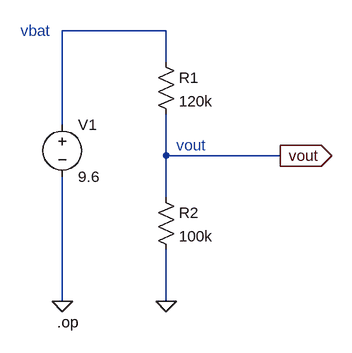
[diagram p0: schematic 01_op_dc.asc]
01_op_dc.asc, the LTspice schematic file:
Version 4.1
SHEET 1 880 680
WIRE 336 -80 176 -80
WIRE 336 -32 336 -80
WIRE 176 64 176 -80
WIRE 336 112 336 48
WIRE 512 112 336 112
WIRE 336 176 336 112
WIRE 176 336 176 144
WIRE 336 336 336 256
FLAG 336 336 0
FLAG 176 336 0
FLAG 512 112 vout
IOPIN 512 112 Out
SYMBOL voltage 176 48 R0
WINDOW 123 0 0 Left 0
WINDOW 39 0 0 Left 0
SYMATTR InstName V1
SYMATTR Value 9.6
SYMBOL res 320 -48 R0
SYMATTR InstName R1
SYMATTR Value 120k
SYMBOL res 320 160 R0
SYMATTR InstName R2
SYMATTR Value 100k
TEXT 168 368 Left 2 !.op
TEXT 112 -80 Left 2 ;vbat
TEXT 352 96 Left 2 ;vout

The netlist it stands for:
* 01_op_dc.asc
V1 N001 0 9.6
R1 N001 vout 120k
R2 vout 0 100k
.op
* vbat
* vout
.backanno
.end